# EAGLE design ampli (EAGLE 9.6.2)

## Sheet 1 of 2
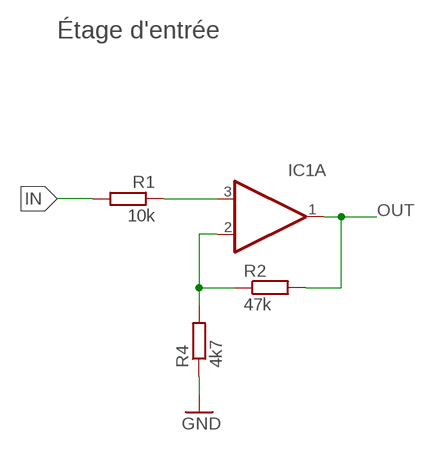
[diagram p0: schematic, sheet 1]

### Parts
IC1  LM358N  [DIL08]
R1  10k  R-EU_R0603  [R0603]
R2  47k  R-EU_R0603  [R0603]
R4  4k7  R-EU_R0603  [R0603]

### Nets
GND: R4.1 ; also sheet 2
IN: R1.2
N$1: IC1.3(A:+IN) R1.1
N$2: IC1.2(A:-IN) R2.1 R4.2
OUT: IC1.1(A:OUT) R2.2 ; also sheet 2
Unconnected: IC1.5(B:+IN) IC1.6(B:-IN) IC1.7(B:OUT)

### Notes on the sheet
- Étage d'entrée

## Sheet 2 of 2
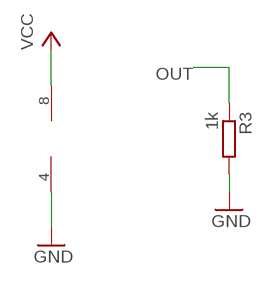
[diagram p1: schematic, sheet 2]

### Parts
R3  1k  R-EU_R0603  [R0603]

### Nets
GND: IC1.4(P:V-) R3.2 ; also sheet 1
OUT: R3.1 ; also sheet 1
VCC: IC1.8(P:V+)

## Library data of the parts
IC1 = linear:LM358: Double amplificateur opérationnel
R1 R2 R4 = rcl:R-EU_: RESISTOR, European symbol
R3 = rcl:R-EU_: RESISTOR, European symbol; MPN: RC0603FR-071KL

## Board
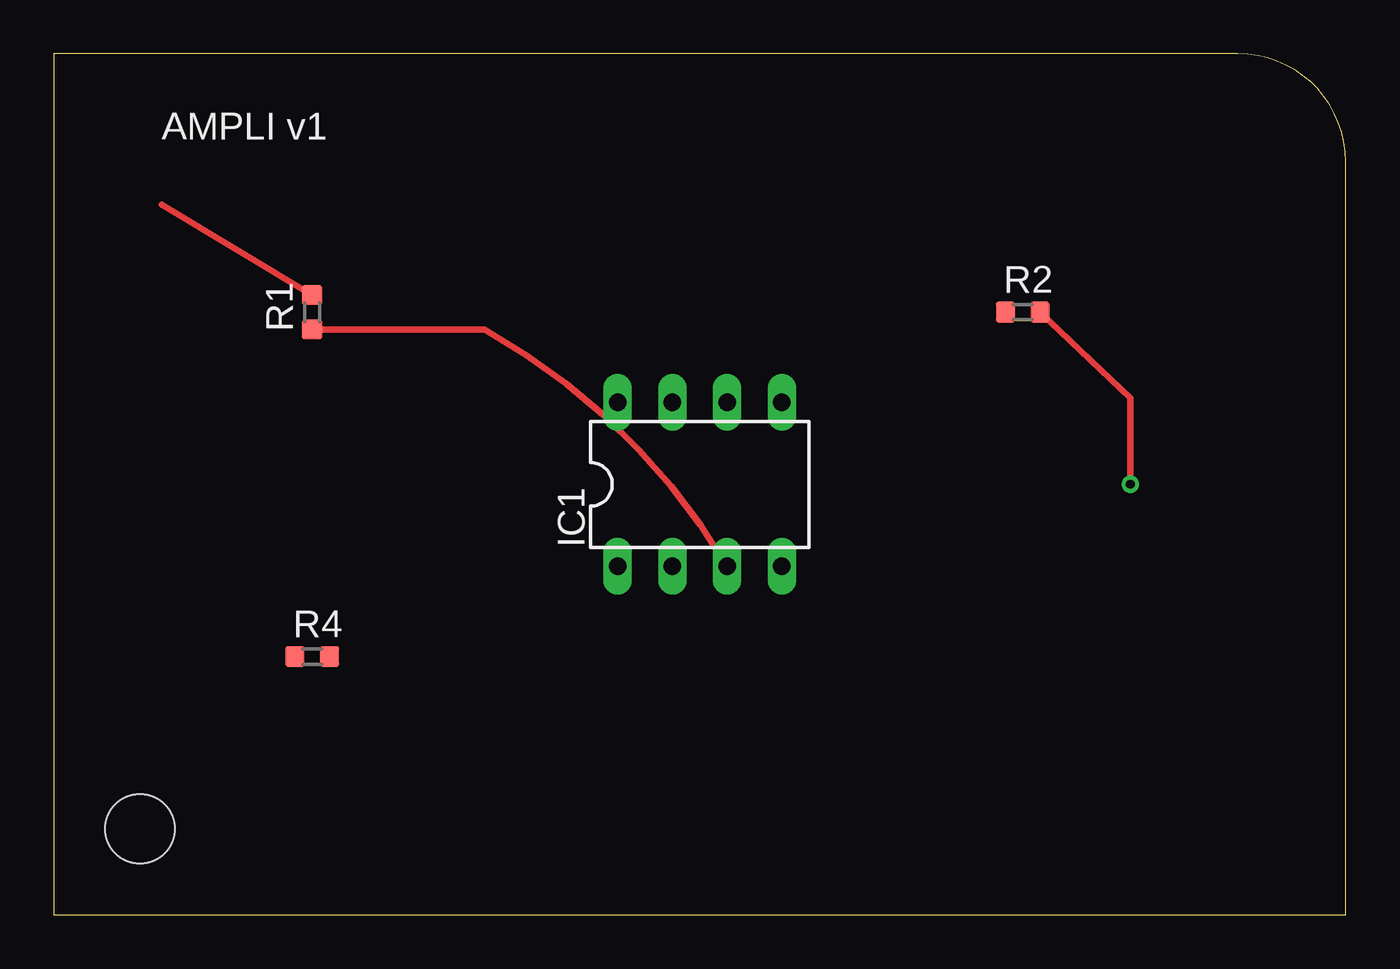
[diagram p2: board, top side]
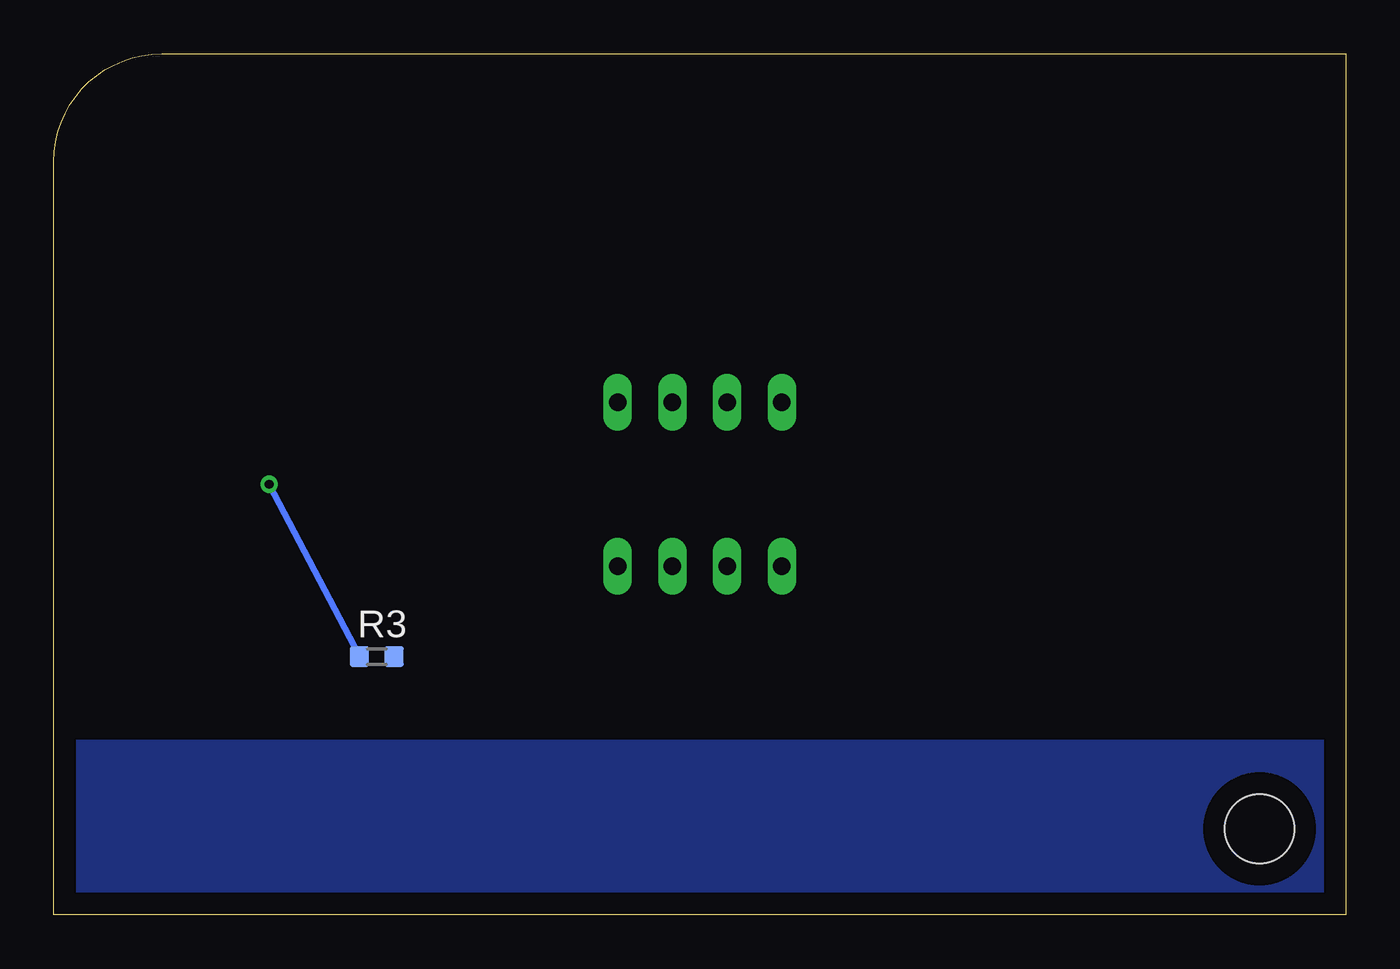
[diagram p3: board, bottom side, seen from below]

Size 60 x 40 mm. Coordinates in mm from the lower left corner, seen from the top.
Outline: 0,0 60,0 60,35 arc90 55,40 0,40 0,0
Copper layers used: Top, Bottom
Design rules "default": track to track 8mil
Holes 3.2 mm at 4,4

### Footprints (pad centres in the part's own frame; a part is rotated, then mirrored left to right if it is on the bottom)
DIL08 = drill 0.813 long: 1 -3.81,-3.81; 2 -1.27,-3.81; 3 1.27,-3.81; 4 3.81,-3.81; 5 3.81,3.81; 6 1.27,3.81; 7 -1.27,3.81; 8 -3.81,3.81
R0603 = smd 0.9 x 0.95: 1 -0.8,0; 2 0.8,0

### Placement (x,y rotation side)
IC1  30,20 0 top
R1  12,28 90 top
R2  45,28 0 top
R3  45,12 0 bottom
R4  12,12 0 top

### Tracks (layer width: path | path; a pad name or v marks a point on that pad's centre or on a via)
GND
  pour Bottom (isolate 0.4): 1,1 59,1 59,8 1,8
IN
  Top 0.305: R1.2 5,33
N$1
  Top 0.305: R1.1 20,27.2 arc-30 IC1.3
OUT  (via drill 0.4)
  Top 0.305: R2.2 50,24 v50,20
  Bottom 0.305: v50,20 R3.1

### Text on the board
tPlace: AMPLI v1